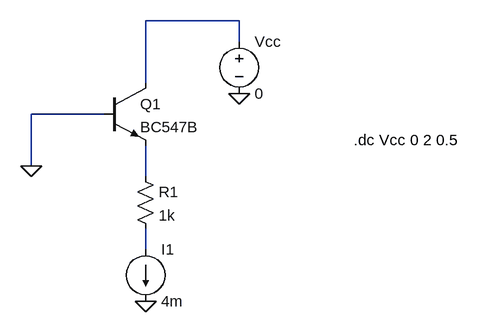
[diagram p0: schematic Draft2.asc]
Draft2.asc, the LTspice schematic file:
Version 4.1
SHEET 1 880 680
WIRE 288 -80 144 -80
WIRE 288 -48 288 -80
WIRE 144 16 144 -80
WIRE 80 64 -32 64
WIRE -32 144 -32 64
WIRE 144 160 144 112
WIRE 144 272 144 240
FLAG -32 144 0
FLAG 144 352 0
FLAG 288 32 0
SYMBOL npn 80 16 R0
SYMATTR InstName Q1
SYMATTR Value BC547B
SYMBOL res 128 144 R0
SYMATTR InstName R1
SYMATTR Value 1k
SYMBOL current 144 272 R0
SYMATTR InstName I1
SYMATTR Value 4m
SYMBOL voltage 288 -64 R0
SYMATTR InstName Vcc
SYMATTR Value 0
TEXT 464 104 Left 2 !.dc Vcc 0 2 0.5

The netlist it stands for:
* Draft2.asc
Q1 N001 0 N002 0 BC547B
R1 N002 N003 1k
I1 N003 0 4m
Vcc N001 0 0
.model NPN NPN
.model PNP PNP
.lib standard.bjt
.dc Vcc 0 2 0.5
.backanno
.end

* Results of the author's LTspice run, read from the files saved beside the schematic
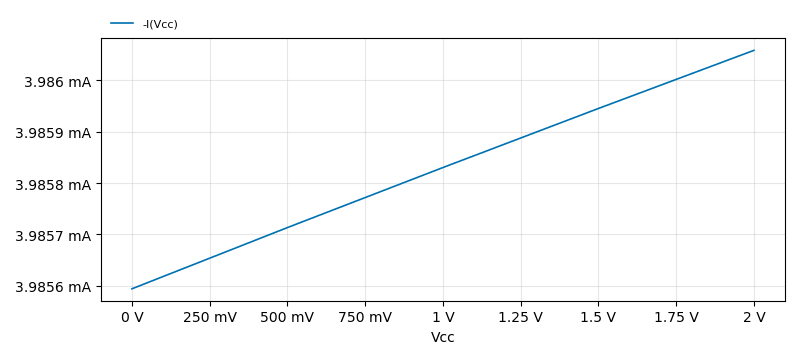
[diagram p1: DC transfer characteristic of Draft2.asc, plotted from the saved traces]
* DC transfer characteristic, 1 run:
*   -I(Vcc): 3.986 mA at Vcc=0 V, 3.986 mA at Vcc=2 V, min 3.986 mA, max 3.986 mA